# Altium project Remote-Wiremap-Tester-v1.0.PrjPcb
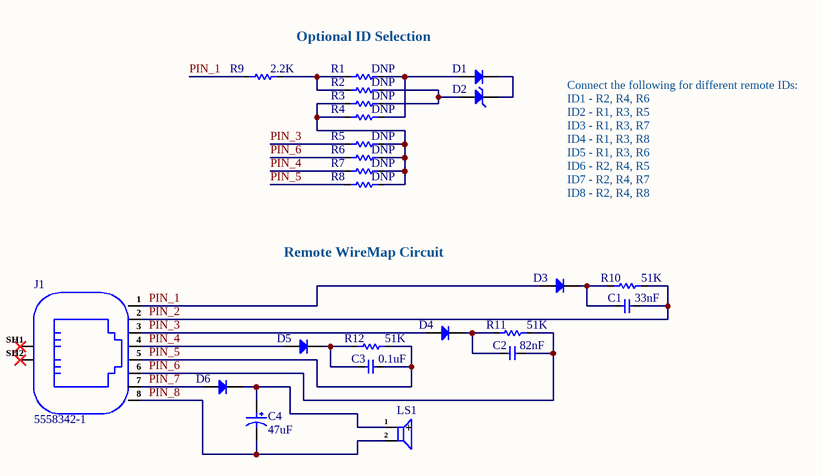
[diagram p0: Sheet1.SchDoc]
1 sheet, 24 parts. Net scope: global (net labels, ports and power ports of the same name join across sheets).

## Sheet Sheet1.SchDoc
size A4; SheetNumber: 1; SheetTotal: 1

### Parts
C1  33nF  [Cap-0603]
C2  82nF  [Cap-0603]
C3  0.1uF  [Cap-0603]
C4  47uF  [EEE-FK1C470SR]
D1  1N4148W-7-F  [SOD-123]  (value not drawn)
D2  MM3Z3V3B  [SOD323F]  (value not drawn)
D3  1N4148W-7-F  [SOD-123]  (value not drawn)
D4  1N4148W-7-F  [SOD-123]  (value not drawn)
D5  1N4148W-7-F  [SOD-123]  (value not drawn)
D6  1N4148W-7-F  [SOD-123]  (value not drawn)
J1  5558342-1  [5558342-1]
LS1  GMD0955YB-3V2700  [GMD0955YB-3V2700]  (value not drawn)
R1  DNP  [Res-0603]
R2  DNP  [Res-0603]
R3  DNP  [Res-0603]
R4  DNP  [Res-0603]
R5  DNP  [Res-0603]
R6  DNP  [Res-0603]
R7  DNP  [Res-0603]
R8  DNP  [Res-0603]
R9  2.2K  [Res-0603]
R10  51K  [Res-0603]
R11  51K  [Res-0603]
R12  51K  [Res-0603]

### Nets
PIN_1: D3.1(A) J1.1 R9.1
PIN_2: C1.2 J1.2 R10.2
PIN_3: D4.1(A) J1.3 R5.1
PIN_4: D5.1(A) J1.4 R7.1
PIN_5: C3.2 J1.5 R8.1 R12.2
PIN_6: C2.2 J1.6 R6.1 R11.2
PIN_7: D6.1(A) J1.7
PIN_8: C4.2 J1.8 LS1.2(-)
NetC1_1: C1.1 D3.2(K) R10.1
NetC2_1: C2.1 D4.2(K) R11.1
NetC3_1: C3.1 D5.2(K) R12.1
NetC4_1: C4.1 D6.2(K) LS1.1(+)
NetD1_1: D1.1(A) R1.2 R4.2
NetD1_2: D1.2(K) D2.2(K)
NetD2_1: D2.1(A) R2.2 R3.2
NetR1_1: R1.1 R2.1 R9.2
NetR3_1: R3.1 R4.1 R5.2 R6.2 R7.2 R8.2

Not connected (* = marked no-connect by the designer): J1 SH1(SHIELD)* SH2(SHIELD)*

### Notes on the sheet
- Optional ID Selection
- Remote WireMap Circuit
- Connect the following for different remote IDs:
  ID1 - R2, R4, R6
  ID2 - R1, R3, R5
  ID3 - R1, R3, R7
  ID4 - R1, R3, R8
  ID5 - R1, R3, R6
  ID6 - R2, R4, R5
  ID7 - R2, R4, R7
  ID8 - R2, R4, R8
- File:
- Title:
- Date:
- Page
- Num:
- Total:
- Drawn By: Huzaifa Ali

### Library data of the parts
C1 = CC0603JRX7R8BB333: CAP CER 0.033UF 25V X7R 0603; Manufacturer: Yageo; Item Type: Capacitors; Supplier: Digikey; LCSC Part Number: C519544; Manufacturer Part Number: CC0603JRX7R8BB333; RoHS: Yes; Stock: 19887; Pricing: 1=0.1, 10=0.067, 50=0.0398, 100=0.0314, 500=0.02316, 1000=0.01918 (USD); Lead Free: 5697LeadFree; Halogen Free: 5694HalogenFree; ComponentLink1URL: https://datasheet.ciiva.com/11465/upy-gphc-x7r-6-3v-to-50v-8-11465034.pdf?src-supplier=Avnet; ComponentLink1Description: https://datasheet.ciiva.com/11465/upy-gphc-x7r-6-3v-to-50v-8-11465034.pdf?src-supplier=Avnet
C2 = CC0603JRX7R8BB823: CAP CER 0.082UF 25V X7R 0603; Manufacturer: Yageo; Item Type: Capacitors; Tolerance: 5%; Supplier: Arrow Electronics; LCSC Part Number: C519548; Manufacturer Part Number: CC0603JRX7R8BB823; RoHS: Yes; Stock: 20000; Pricing: 4000=0.0203, 8000=0.0188, 12000=0.0181, 20000=0.0174, 24000=0.0158, 28000=0.0154, 40000=0.0149, 100000=0.0127, 200000=0.0122, 400000=0.0119 (USD); Mounting Technology: Surface Mount; Case/Package: 0603; Case Code (Imperial): 0603; Case Code (Metric): 1608; Weight: 7.1E-05oz; Min Operating Temperature: -55°C; Max Operating Temperature: 125°C; Value: 82nF; Packaging: Tape and Reel; Voltage Rating (DC): 25V; Dielectric: X7R; Voltage Rating: 25V; Termination: SMD/SMT; Series: CC; Length: 0.063inch; Width: 0.031inch; Thickness: 0.035inch; Lead Free: Lead Free; Halogen Free: Halogen Free; RoHS Compliant: Yes; ComponentLink1URL: http://www.mouser.com/ds/2/447/Yageo_UPY-GP_NP0_16V-to-50V_9-358835.pdf?src-supplier=Mouser; ComponentLink1Description: http://www.mouser.com/ds/2/447/Yageo_UPY-GP_NP0_16V-to-50V_9-358835.pdf?src-supplier=Mouser; ComponentLink2URL: http://www.yageo.com/exep/pages/download/literatures/ProductSelectionGuide%202014_Final_2.pdf?src-supplier=Digikey; ComponentLink2Description: http://www.yageo.com/exep/pages/download/literatures/ProductSelectionGuide%202014_Final_2.pdf?src-supplier=Digikey
C3 = CC0603JRX7R8BB104: CAP CER 0.1UF 25V X7R 0603; Manufacturer: Yageo; Item Type: Capacitors; Tolerance: 5%; Value: 100nF; Supplier: Digikey; LCSC Part Number: C327087; Manufacturer Part Number: CC0603JRX7R8BB104; RoHS: Yes; Stock: 448767; Pricing: 1=0.1, 10=0.057, 50=0.039, 100=0.0335, 500=0.02436, 1000=0.0215 (USD); Mounting Technology: Surface Mount; Case/Package: 0603; Case Code (Imperial): 0603; Case Code (Metric): 1608; Weight: 7.1E-05oz; Min Operating Temperature: -55°C; Max Operating Temperature: 125°C; Voltage Rating: 25V; Voltage Rating (DC): 25V; Packaging: Tape and Reel; Dielectric: X7R; Termination: SMD/SMT; Series: CC; Construction: Flat; Length: 1.6mm; Width: 0.031inch; Height: 0.8mm; Thickness: 0.035inch; Lead Free: Lead Free; Halogen Free: Halogen Free; RoHS Compliant: Yes; ComponentLink1URL: https://datasheet.ciiva.com/11465/upy-gphc-x7r-6-3v-to-50v-8-11465031.pdf?src-supplier=Avnet; ComponentLink1Description: https://datasheet.ciiva.com/11465/upy-gphc-x7r-6-3v-to-50v-8-11465031.pdf?src-supplier=Avnet
C4 = EEE-FK1C470SR: CAP ALUM 47UF 20% 16V SMD; Manufacturer: Panasonic; Item Type: Capacitors; ESR (Equivalent Series Resistance): 1.35R; Supplier: Mouser; LCSC Part Number: C401706; Manufacturer Part Number: EEE-FK1C470SR; RoHS: No; Stock: 10391; Pricing: 1=0.5, 10=0.246, 50=0.246, 100=0.155, 1000=0.125, 10000=0.098 (USD); Mounting Technology: Surface Mount; Case/Package: Radial; Min Operating Temperature: -55°C; Max Operating Temperature: 105°C; Packaging: Cut Tape; Value: 47uF; Tolerance: 20%; Voltage Rating: 16V; Series: FKS; Ratings: AEC-Q200; ComponentLink1URL: https://media.digikey.com/pdf/Data%20Sheets/Panasonic%20Semiconductors%20ICs%20PDFs/FKS_Series_small_LE_NPI.pdf?src-supplier=Digikey; ComponentLink1Description: https://media.digikey.com/pdf/Data%20Sheets/Panasonic%20Semiconductors%20ICs%20PDFs/FKS_Series_small_LE_NPI.pdf?src-supplier=Digikey; ComponentLink2URL: https://datasheet.octopart.com/EEE-FK1C470SR-Panasonic-datasheet-102492114.pdf?src-supplier=Farnell; ComponentLink2Description: https://datasheet.octopart.com/EEE-FK1C470SR-Panasonic-datasheet-102492114.pdf?src-supplier=Farnell; ComponentLink3URL: https://industrial.panasonic.com/cdbs/www-data/pdf/RDE0000/ABA0000C1251.pdf?src-supplier=Digikey; ComponentLink3Description: https://industrial.panasonic.com/cdbs/www-data/pdf/RDE0000/ABA0000C1251.pdf?src-supplier=Digikey; ComponentLink4URL: https://b2b-api.panasonic.eu/file_stream/pids/fileversion/3102?src-supplier=Digikey; ComponentLink4Description: https://b2b-api.panasonic.eu/file_stream/pids/fileversion/3102?src-supplier=Digikey; ComponentLink5URL: https://datasheet.octopart.com/EEEFK1C470SR-Panasonic-datasheet-150469823.pdf?src-supplier=TME; ComponentLink5Description: https://datasheet.octopart.com/EEEFK1C470SR-Panasonic-datasheet-150469823.pdf?src-supplier=TME
D1 D3-D6 = 1N4148W-7-F: DIODE GEN PURP 100V 300MA SOD123; Manufacturer: Diodes; Forward Current: 150mA; Reverse Recovery Time: 4ns; Max Forward Surge Current (Ifsm): 2A; Element Configuration: Single; Max Reverse Current: 1uA; Forward Voltage: 1.25V; Power Dissipation: 400mW; Polarity: Standard; Voltage Rating (DC): 75V; Value: 2pF; Supplier 1: Future Electronics; Manufacturer Part Number: 1N4148W-7-F; RoHS: Yes; Category: Rectifier Diodes; Stock 1: 32931000; Pricing 1: 3000=0.01840, 12000=0.01760, 45000=0.01690, 120000=0.01640, 300000=0.01560 (USD); Mounting Technology: Surface Mount; Pins: 2; Weight: 0.000353oz; Contact Plating: Tin,Matte; Min Operating Temperature: -65°C; Max Operating Temperature: 150°C; Packaging: Tape and Reel; Max Repetitive Reverse Voltage (Vrrm): 100V; Peak Non-Repetitive Surge Current: 2A; Voltage: 100V; Max Surge Current: 2A; Package Quantity: 3000; Recovery Time: 4ns; Average Rectified Current: 300mA; Power Rating: 400mW; Current Rating: 150mA; Output Current: 150mA; Max Reverse Voltage (DC): 100V; Series: -; Reverse Recovery Time-Max: 4ns; Length: 2.85mm; Width: 1.7mm; Height: 1.25mm; Radiation Hardening: No; RoHS Compliant: Yes; Reach SVHC Compliant: Yes; Lead Free: Lead Free; ComponentLink1URL: https://datasheet.ciiva.com/1179/1915529-1179304.pdf?src-supplier=Element14; ComponentLink1Description: https://datasheet.ciiva.com/1179/1915529-1179304.pdf?src-supplier=Element14; ComponentLink2URL: https://datasheet.ciiva.com/22695/1915529-22695239.pdf?src-supplier=Element14; ComponentLink2Description: https://datasheet.ciiva.com/22695/1915529-22695239.pdf?src-supplier=Element14; ComponentLink3URL: https://datasheet.ciiva.com/8300/ds30086-8300392.pdf?src-supplier=Avnet; ComponentLink3Description: https://datasheet.ciiva.com/8300/ds30086-8300392.pdf?src-supplier=Avnet; ComponentLink4URL: https://datasheet.ciiva.com/15219/getdatasheetpartid-110030-15219548.pdf?src-supplier=Verical; ComponentLink4Description: https://datasheet.ciiva.com/15219/getdatasheetpartid-110030-15219548.pdf?src-supplier=Verical; ComponentLink5URL: https://datasheet.ciiva.com/8303/ds30086-8303197.pdf?src-supplier=Avnet; ComponentLink5Description: https://datasheet.ciiva.com/8303/ds30086-8303197.pdf?src-supplier=Avnet; ComponentLink6URL: https://datasheet.ciiva.com/911/ds30086-911735.pdf?src-supplier=Digi-Key; ComponentLink6Description: https://datasheet.ciiva.com/911/ds30086-911735.pdf?src-supplier=Digi-Key; ComponentLink7URL: https://datasheet.ciiva.com/911/ds30086-911736.pdf?src-supplier=Digi-Key; ComponentLink7Description: https://datasheet.ciiva.com/911/ds30086-911736.pdf?src-supplier=Digi-Key; ComponentLink8URL: https://datasheet.ciiva.com/911/ds30086-911734.pdf?src-supplier=Digi-Key; ComponentLink8Description: https://datasheet.ciiva.com/911/ds30086-911734.pdf?src-supplier=Digi-Key; ComponentLink9URL: https://datasheet.ciiva.com/4435/ds30086-4435128.pdf?src-supplier=Mouser; ComponentLink9Description: https://datasheet.ciiva.com/4435/ds30086-4435128.pdf?src-supplier=Mouser; Supplier Part Number 1: 7634694; LCSC Part Number: C83528; Item Type: Diode
D2 = MM3Z3V3B: DIODE ZENER 3.3V 200MW SOD323F; Manufacturer: ON Semiconductor / Fairchild; Forward Voltage: 1V; Tolerance: 2%; Impedance: 89R; Max Reverse Leakage Current: 4.5uA; Test Current: 5mA; Element Configuration: Single; Supplier 1: Digi-Key; Manufacturer Part Number: MM3Z3V3B; Stock 1: 473644; Pricing 1: 1=0.22, 10=0.18, 100=0.0956, 500=0.06288, 1000=0.04276 (USD); Mount: Surface Mount; Number of Pins: 2; Weight: 0.0276g; Min Operating Temperature: -65°C; Max Operating Temperature: 150°C; Packaging: Tape and Reel; Package Quantity: 1; Max Power Dissipation: 200mW; Zener Voltage: 3.3V; Voltage Tolerance: 2%; Power Dissipation: 200mW; Working Voltage: 3.3V; Peak Reverse Current: 4.5uA; Length: 1.3mm; Height: 1mm; Width: 1.7mm; Radiation Hardening: No; REACH SVHC: No SVHC; Lead Free: Lead Free; ComponentLink1URL: http://www.onsemi.com/pub/Collateral/MM3Z9V1B-D.pdf?src-supplier=Digi-Key; ComponentLink1Description: http://www.onsemi.com/pub/Collateral/MM3Z9V1B-D.pdf?src-supplier=Digi-Key; ComponentLink2URL: http://www.mouser.com/ds/2/149/MM3Z3V3B-187166.pdf?src-supplier=Mouser; ComponentLink2Description: http://www.mouser.com/ds/2/149/MM3Z3V3B-187166.pdf?src-supplier=Mouser; ComponentLink3URL: https://www.fairchildsemi.com/datasheets/MM/MM3Z9V1B.pdf?src-supplier=Avnet; ComponentLink3Description: https://www.fairchildsemi.com/datasheets/MM/MM3Z9V1B.pdf?src-supplier=Avnet; ComponentLink4URL: http://www.farnell.com/datasheets/1706525.pdf?src-supplier=Element14; ComponentLink4Description: http://www.farnell.com/datasheets/1706525.pdf?src-supplier=Element14; Supplier Part Number 1: MM3Z3V3BCT-ND; LCSC Part Number: C2978865; Item Type: Diode
J1 = 5558342-1: CONN MOD JACK 8P8C R/A SHIELDED; Manufacturer: TE Connectivity; Item Type: Ethernet Connectors; Current Rating: 200mA; Circuit Application: 5778ConnectorType; Plating Thickness: 1.27um; Supplier: Future Electronics; LCSC Part Number: C305973; Manufacturer Part Number: 5558342-1; RoHS: No; Stock: 5400; Pricing: 1=2.48, 25=2.38, 75=2.32, 90=2.34, 180=2.3, 200=2.26, 270=2.28, 450=2.25, 500=2.15, 900=2.19 (USD); Lead Free: 5697LeadFree; ComponentLink1URL: https://datasheet.ciiva.com/8007/1637342-8007798.pdf?src-supplier=Element14; ComponentLink1Description: https://datasheet.ciiva.com/8007/1637342-8007798.pdf?src-supplier=Element14; ComponentLink2URL: https://datasheet.ciiva.com/15170/getdatasheetpartid-155261-15170633.pdf?src-supplier=Verical; ComponentLink2Description: https://datasheet.ciiva.com/15170/getdatasheetpartid-155261-15170633.pdf?src-supplier=Verical; ComponentLink3URL: https://datasheet.ciiva.com/30494/0900766b8121ec01-30494367.pdf?src-supplier=Rs; ComponentLink3Description: https://datasheet.ciiva.com/30494/0900766b8121ec01-30494367.pdf?src-supplier=Rs; ComponentLink4URL: https://datasheet.ciiva.com/685/eng-cd-5558342-f-basefilename-685330.pdf?src-supplier=Digikey; ComponentLink4Description: https://datasheet.ciiva.com/685/eng-cd-5558342-f-basefilename-685330.pdf?src-supplier=Digikey; ComponentLink5URL: https://datasheet.ciiva.com/19457/958999-19457716.pdf?src-supplier=Jameco; ComponentLink5Description: https://datasheet.ciiva.com/19457/958999-19457716.pdf?src-supplier=Jameco; ComponentLink6URL: https://datasheet.ciiva.com/14618/70042946-14618796.pdf?src-supplier=Allied+Electronics; ComponentLink6Description: https://datasheet.ciiva.com/14618/70042946-14618796.pdf?src-supplier=Allied+Electronics; ComponentLink7URL: https://datasheet.ciiva.com/30242/eng-cs-82066-mod-jacks-and-mrj21-prod-single-1107-30242663.pdf?src-supplier=Onlinecomponents.com; ComponentLink7Description: https://datasheet.ciiva.com/30242/eng-cs-82066-mod-jacks-and-mrj21-prod-single-1107-30242663.pdf?src-supplier=Onlinecomponents.com; ComponentLink8URL: https://datasheet.ciiva.com/3138/eng-cs-82066-mod-jacks-and-mrj21-prod-single-1107-3138695.pdf?src-supplier=Avnet; ComponentLink8Description: https://datasheet.ciiva.com/3138/eng-cs-82066-mod-jacks-and-mrj21-prod-single-1107-3138695.pdf?src-supplier=Avnet
LS1 = GMD0955YB-3V2700: 80dB Active (Built-in Driver Circuit) Electromagnetic Type 2.7kHz Buzzers ROHS; Manufacturer: INGHAi; Manufacturer Part Number: GMD0955YB-3V2700; Package: Custom; LCSC Part Number: C252933; Item Type: Buzzers; ComponentLink1Description: LCSC; ComponentLink1URL: https://www.lcsc.com/product-detail/Buzzers_INGHAi-GMD0955YB-3V2700_C252933.html
R1-R8 = RC0603JR-070RL: RES 0 OHM JUMPER 1/10W 0603; Manufacturer: Yageo; Resistance: 0mR; Tolerance: 1%; Power Rating: 100mW; Voltage Rating (DC): 50V; Temperature Coefficient: 200ppm/°C; Resistance Tolerance: 5%; Item Type: Resistor; Supplier 1: Digi-Key; Manufacturer Part Number: RC0603JR-070RL; RoHS: Yes; Category: Chip SMD Resistors; Stock 1: 18081776; Pricing 1: 1=0.10000, 10=0.01700, 25=0.01240, 50=0.00960, 100=0.00700, 250=0.00536, 500=0.00430, 1000=0.00316 (USD); Case/Package: 0603; Number of Pins: 2; Contact Plating: Tin,Matte; Case Code (Imperial): 0603; Case Code (Metric): 1608; Size Code: 0603; Min Operating Temperature: -55°C; Max Operating Temperature: 155°C; Resistor Type: Thick Film; Packaging: Tape and Reel; Termination: SMD/SMT; Series: RC; Technology: THICK FILM; Package Quantity: 5000; Voltage Rating: 50V; Features: Moisture Resistant; Max Power Dissipation: 100mW; Number of Terminations: 2; Construction: Rectangular; Length: 1.6mm; Width: 0.8mm; Height: 0.45mm; Depth: 0.8mm; Radiation Hardening: No; Reach SVHC Compliant: No SVHC; Lead Free: Lead Free; RoHS Compliant: Yes; Military Standard: Not; Supplier Part Number 1: 311-0.0GRCT-ND; LCSC Part Number: C95177
R9 = RC0603FR-072K2L: RES 2.2K OHM 1% 1/10W 0603; Manufacturer: Yageo; Resistance: 2.2kR; Temperature Coefficient: 100ppm/°C; Power Rating: 100mW; Voltage Rating: 50V; Item Type: Resistor; Supplier 1: Avnet; Manufacturer Part Number: RC0603FR-072K2L; RoHS: Yes; Category: Chip SMD Resistors; Stock 1: 733100; Pricing 1: 5000=0.00133, 10000=0.00131, 20000=0.00127 (USD); Case/Package: 0603; Case Code (Imperial): 0603; Case Code (Metric): 1608; Size Code: 0603; Min Operating Temperature: -55°C; Max Operating Temperature: 155°C; Tolerance: 1%; Packaging: Tape and Reel; Resistor Type: Thick Film; Package Quantity: 1; Termination: SMD/SMT; Number of Terminations: 2; Max Power Dissipation: 100mW; Features: Moisture Resistant; Series: RC; Resistance Tolerance: 1%; Construction: Rectangular; Length: 1.6mm; Width: 0.031inch; Height: 0.022inch; Depth: 0.8mm; Lead Free: Lead Free; Military Standard: Not; RoHS Compliant: Yes; Supplier Part Number 1: RC0603FR-072K2L; LCSC Part Number: C114662
R10-R12 = RC0603FR-0751KL: RES 51K OHM 1% 1/10W 0603; Manufacturer: Yageo; Item Type: Resistors; Value: 51kR; Power Rating: 100mW; Voltage Rating: 50V; Temperature Coefficient: 100ppm/°C; Supplier: Future Electronics; LCSC Part Number: C107231; Manufacturer Part Number: RC0603FR-0751KL; RoHS: Yes; Stock: 1155000; Pricing: 5000=0.0024, 50000=0.0023, 150000=0.0022, 375000=0.0021, 1000000=0.002 (USD); Case/Package: 0603; Pins: 2NUMBER; Case Code (Imperial): 0603; Case Code (Metric): 1608; Min Operating Temperature: -55°C; Max Operating Temperature: 155°C; Tolerance: 1%; Packaging: Tape and Reel; Package Quantity: 1; Termination: SMD/SMT; Resistor Type: Thick Film; Number of Terminations: 2; Max Power Dissipation: 100mW; Features: Moisture Resistant; Series: RC; Resistance Tolerance: 1%; Technology: THICK FILM; Voltage Rating (DC): 50V; Length: 1.6mm; Width: 0.031inch; Height: 0.45mm; Depth: 0.8mm; Reach SVHC Compliant: No; RoHS Compliant: Yes; Lead Free: 5697LeadFree; ComponentLink1URL: https://datasheet.ciiva.com/11819/0900766b80f96399-11819378.pdf?src-supplier=Rs; ComponentLink1Description: https://datasheet.ciiva.com/11819/0900766b80f96399-11819378.pdf?src-supplier=Rs; ComponentLink2URL: https://datasheet.ciiva.com/46395/443971-46395014.pdf?src-supplier=Element14; ComponentLink2Description: https://datasheet.ciiva.com/46395/443971-46395014.pdf?src-supplier=Element14; ComponentLink3URL: https://datasheet.ciiva.com/2454/pyu-r-int-thick-7-2454124.pdf?src-supplier=Digikey; ComponentLink3Description: https://datasheet.ciiva.com/2454/pyu-r-int-thick-7-2454124.pdf?src-supplier=Digikey; ComponentLink4URL: https://datasheet.ciiva.com/2454/pyu-r-int-thick-7-2454125.pdf?src-supplier=Digikey; ComponentLink4Description: https://datasheet.ciiva.com/2454/pyu-r-int-thick-7-2454125.pdf?src-supplier=Digikey; ComponentLink5URL: https://datasheet.ciiva.com/2454/pyu-r-int-thick-7-2454123.pdf?src-supplier=Digikey; ComponentLink5Description: https://datasheet.ciiva.com/2454/pyu-r-int-thick-7-2454123.pdf?src-supplier=Digikey; ComponentLink6URL: https://datasheet.ciiva.com/12558/rc0603-272842-12558554.pdf?src-supplier=Mouser; ComponentLink6Description: https://datasheet.ciiva.com/12558/rc0603-272842-12558554.pdf?src-supplier=Mouser